# Altium project Lattice_FPGA_development_board.PrjPcb (part 2 of 2)

## Sheet seven_segment_displays.SchDoc
size A3; SheetNumber: 12; SheetTotal: 18; SPICEModelCacheAGOJJZQO: <root> / <DocumentId>AGOJJZQO</DocumentId> / </root>
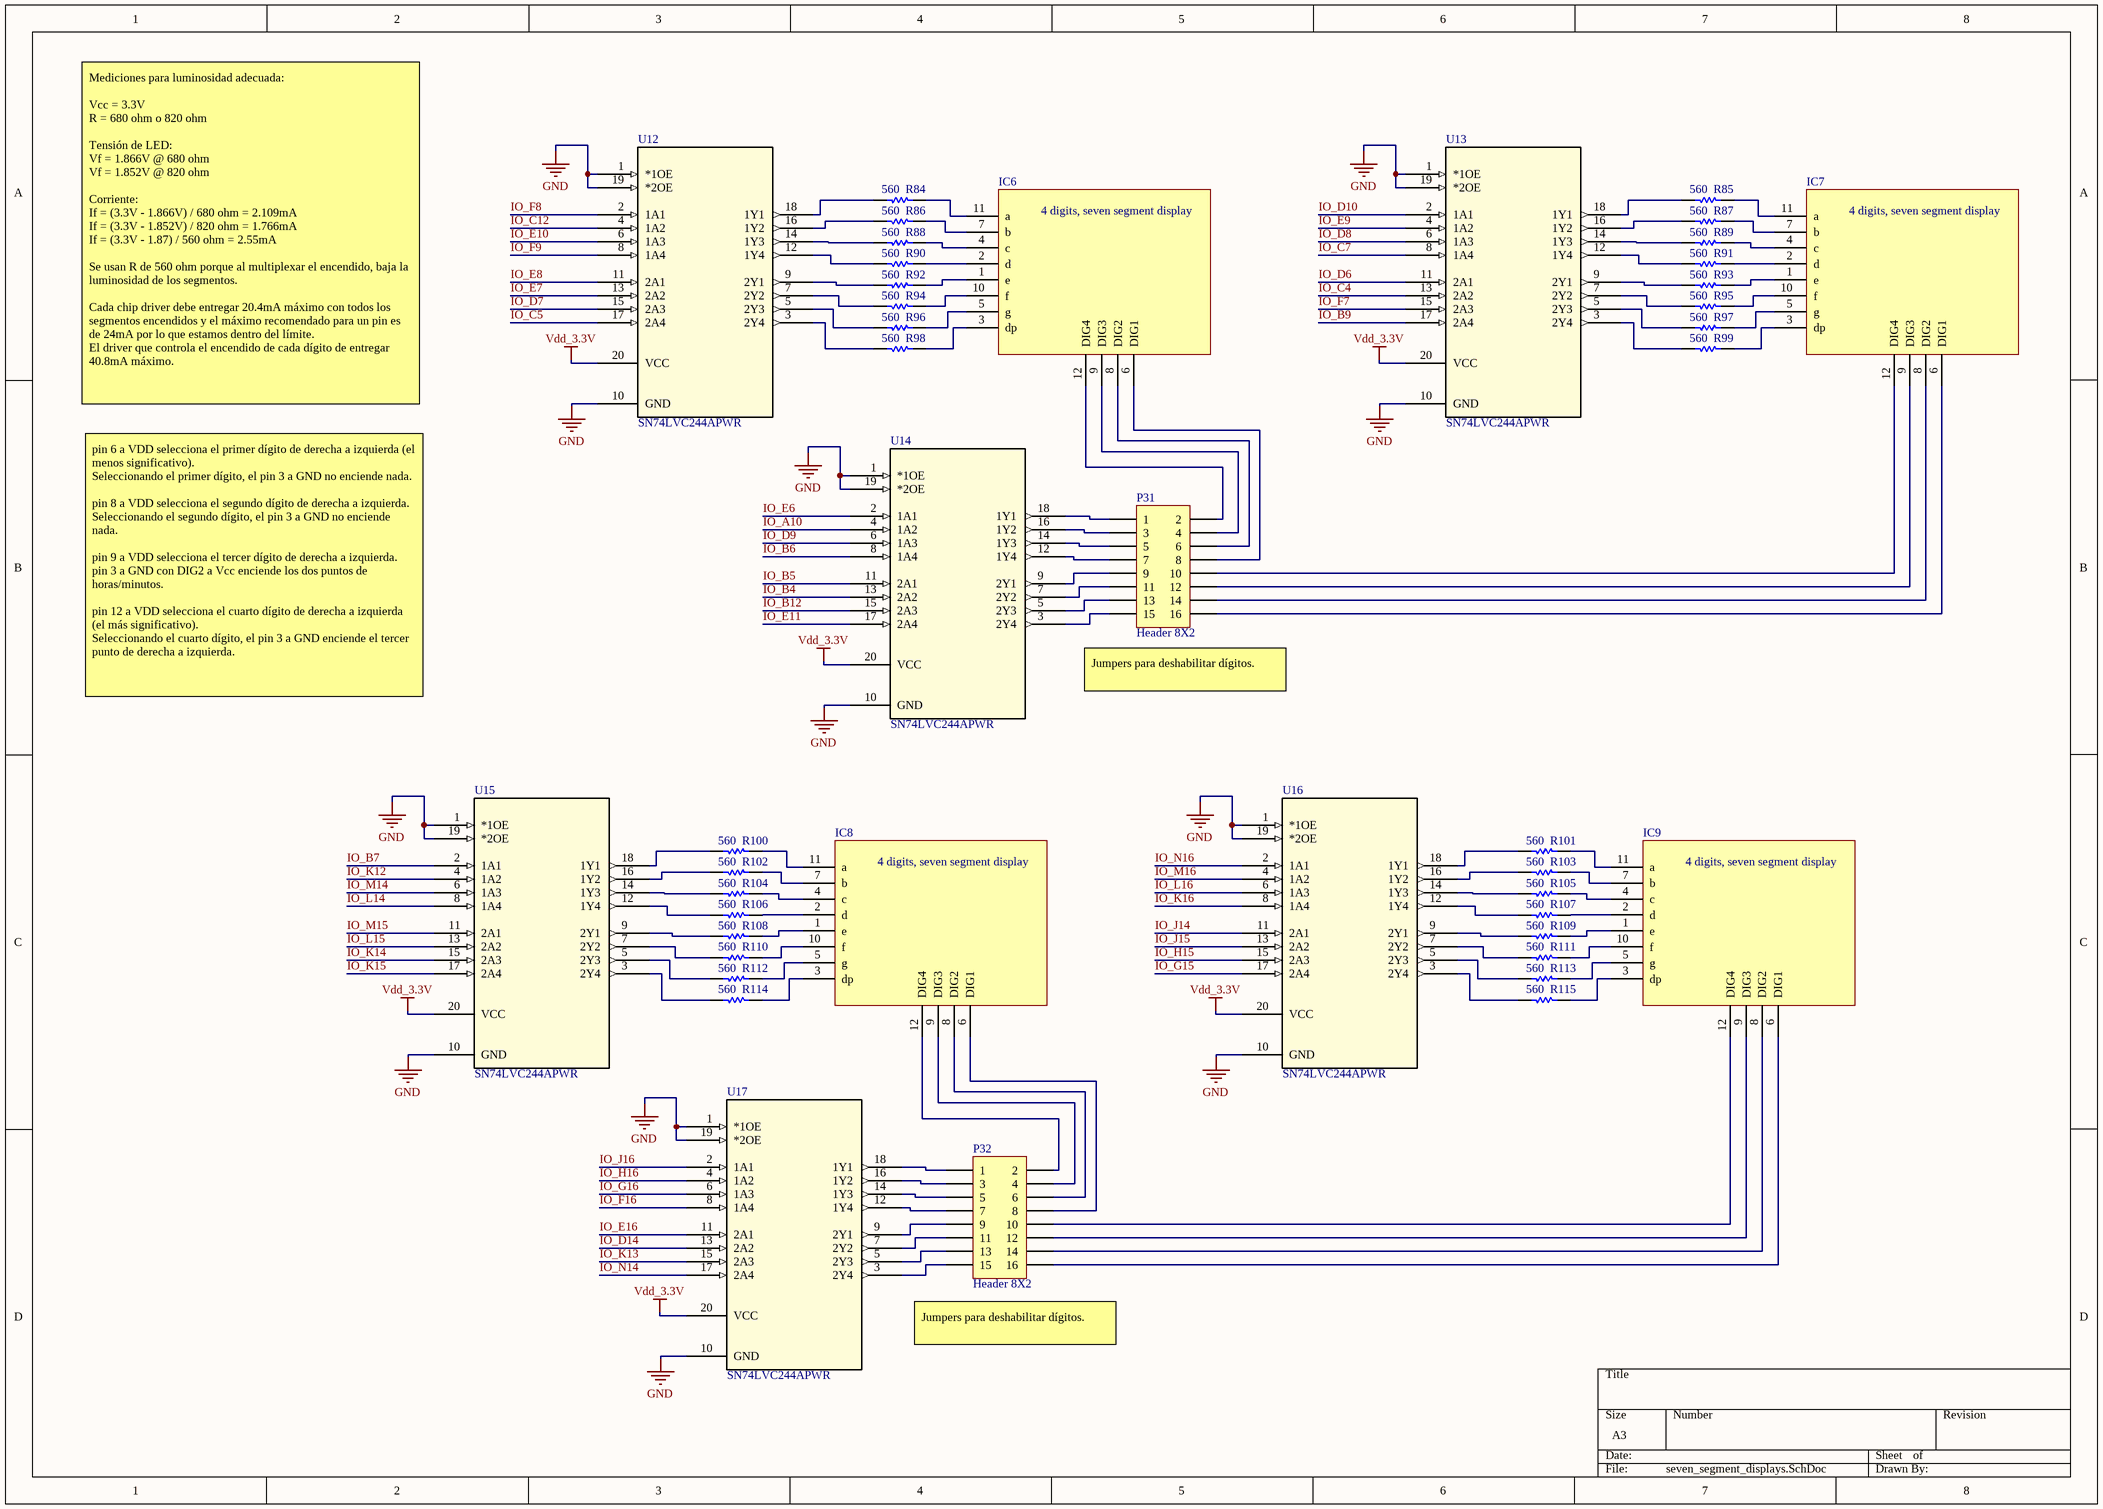
[diagram p10: seven_segment_displays.SchDoc]

### Parts
IC6  Seven segment display x 4 digits  [4 digit, seven segment display / 50.3mm x 19mm]  (value not drawn)
IC7  Seven segment display x 4 digits  [4 digit, seven segment display / 50.3mm x 19mm]  (value not drawn)
IC8  Seven segment display x 4 digits  [4 digit, seven segment display / 50.3mm x 19mm]  (value not drawn)
IC9  Seven segment display x 4 digits  [4 digit, seven segment display / 50.3mm x 19mm]  (value not drawn)
P31  Header 8X2  [HDR2X8]
P32  Header 8X2  [HDR2X8]
R84  value 560  [resistor 0603]  (hidden comment: resistor)
R85  value 560  [resistor 0603]  (hidden comment: resistor)
R86  value 560  [resistor 0603]  (hidden comment: resistor)
R87  value 560  [resistor 0603]  (hidden comment: resistor)
R88  value 560  [resistor 0603]  (hidden comment: resistor)
R89  value 560  [resistor 0603]  (hidden comment: resistor)
R90  value 560  [resistor 0603]  (hidden comment: resistor)
R91  value 560  [resistor 0603]  (hidden comment: resistor)
R92  value 560  [resistor 0603]  (hidden comment: resistor)
R93  value 560  [resistor 0603]  (hidden comment: resistor)
R94  value 560  [resistor 0603]  (hidden comment: resistor)
R95  value 560  [resistor 0603]  (hidden comment: resistor)
R96  value 560  [resistor 0603]  (hidden comment: resistor)
R97  value 560  [resistor 0603]  (hidden comment: resistor)
R98  value 560  [resistor 0603]  (hidden comment: resistor)
R99  value 560  [resistor 0603]  (hidden comment: resistor)
R100  value 560  [resistor 0603]  (hidden comment: resistor)
R101  value 560  [resistor 0603]  (hidden comment: resistor)
R102  value 560  [resistor 0603]  (hidden comment: resistor)
R103  value 560  [resistor 0603]  (hidden comment: resistor)
R104  value 560  [resistor 0603]  (hidden comment: resistor)
R105  value 560  [resistor 0603]  (hidden comment: resistor)
R106  value 560  [resistor 0603]  (hidden comment: resistor)
R107  value 560  [resistor 0603]  (hidden comment: resistor)
R108  value 560  [resistor 0603]  (hidden comment: resistor)
R109  value 560  [resistor 0603]  (hidden comment: resistor)
R110  value 560  [resistor 0603]  (hidden comment: resistor)
R111  value 560  [resistor 0603]  (hidden comment: resistor)
R112  value 560  [resistor 0603]  (hidden comment: resistor)
R113  value 560  [resistor 0603]  (hidden comment: resistor)
R114  value 560  [resistor 0603]  (hidden comment: resistor)
R115  value 560  [resistor 0603]  (hidden comment: resistor)
U12  SN74LVC244APWR  [PW20]
U13  SN74LVC244APWR  [PW20]
U14  SN74LVC244APWR  [PW20]
U15  SN74LVC244APWR  [PW20]
U16  SN74LVC244APWR  [PW20]
U17  SN74LVC244APWR  [PW20]

### Nets
GND: U12.1(*1OE) U12.10(GND) U12.19(*2OE) U13.1(*1OE) U13.10(GND) U13.19(*2OE) U14.1(*1OE) U14.10(GND) U14.19(*2OE) U15.1(*1OE) U15.10(GND) U15.19(*2OE) U16.1(*1OE) U16.10(GND) U16.19(*2OE) U17.1(*1OE) U17.10(GND) U17.19(*2OE)
Vdd_3.3V: U12.20(VCC) U13.20(VCC) U14.20(VCC) U15.20(VCC) U16.20(VCC) U17.20(VCC)
IO_A10: U14.4(1A2)
IO_B4: U14.13(2A2)
IO_B5: U14.11(2A1)
IO_B6: U14.8(1A4)
IO_B7: U15.2(1A1)
IO_B9: U13.17(2A4)
IO_B12: U14.15(2A3)
IO_C4: U13.13(2A2)
IO_C5: U12.17(2A4)
IO_C7: U13.8(1A4)
IO_C12: U12.4(1A2)
IO_D6: U13.11(2A1)
IO_D7: U12.15(2A3)
IO_D8: U13.6(1A3)
IO_D9: U14.6(1A3)
IO_D10: U13.2(1A1)
IO_D14: U17.13(2A2)
IO_E6: U14.2(1A1)
IO_E7: U12.13(2A2)
IO_E8: U12.11(2A1)
IO_E9: U13.4(1A2)
IO_E10: U12.6(1A3)
IO_E11: U14.17(2A4)
IO_E16: U17.11(2A1)
IO_F7: U13.15(2A3)
IO_F8: U12.2(1A1)
IO_F9: U12.8(1A4)
IO_F16: U17.8(1A4)
IO_G15: U16.17(2A4)
IO_G16: U17.6(1A3)
IO_H15: U16.15(2A3)
IO_H16: U17.4(1A2)
IO_J14: U16.11(2A1)
IO_J15: U16.13(2A2)
IO_J16: U17.2(1A1)
IO_K12: U15.4(1A2)
IO_K13: U17.15(2A3)
IO_K14: U15.15(2A3)
IO_K15: U15.17(2A4)
IO_K16: U16.8(1A4)
IO_L14: U15.8(1A4)
IO_L15: U15.13(2A2)
IO_L16: U16.6(1A3)
IO_M14: U15.6(1A3)
IO_M15: U15.11(2A1)
IO_M16: U16.4(1A2)
IO_N14: U17.17(2A4)
IO_N16: U16.2(1A1)
NetIC6_1: IC6.1(e) R92.2
NetIC6_2: IC6.2(d) R90.2
NetIC6_3: IC6.3(dp) R98.2
NetIC6_4: IC6.4(c) R88.2
NetIC6_5: IC6.5(g) R96.2
NetIC6_6: IC6.6(DIG1) P31.8
NetIC6_7: IC6.7(b) R86.2
NetIC6_8: IC6.8(DIG2) P31.6
NetIC6_9: IC6.9(DIG3) P31.4
NetIC6_10: IC6.10(f) R94.2
NetIC6_11: IC6.11(a) R84.2
NetIC6_12: IC6.12(DIG4) P31.2
NetIC7_1: IC7.1(e) R93.2
NetIC7_2: IC7.2(d) R91.2
NetIC7_3: IC7.3(dp) R99.2
NetIC7_4: IC7.4(c) R89.2
NetIC7_5: IC7.5(g) R97.2
NetIC7_6: IC7.6(DIG1) P31.16
NetIC7_7: IC7.7(b) R87.2
NetIC7_8: IC7.8(DIG2) P31.14
NetIC7_9: IC7.9(DIG3) P31.12
NetIC7_10: IC7.10(f) R95.2
NetIC7_11: IC7.11(a) R85.2
NetIC7_12: IC7.12(DIG4) P31.10
NetIC8_1: IC8.1(e) R108.2
NetIC8_2: IC8.2(d) R106.2
NetIC8_3: IC8.3(dp) R114.2
NetIC8_4: IC8.4(c) R104.2
NetIC8_5: IC8.5(g) R112.2
NetIC8_6: IC8.6(DIG1) P32.8
NetIC8_7: IC8.7(b) R102.2
NetIC8_8: IC8.8(DIG2) P32.6
NetIC8_9: IC8.9(DIG3) P32.4
NetIC8_10: IC8.10(f) R110.2
NetIC8_11: IC8.11(a) R100.2
NetIC8_12: IC8.12(DIG4) P32.2
NetIC9_1: IC9.1(e) R109.2
NetIC9_2: IC9.2(d) R107.2
NetIC9_3: IC9.3(dp) R115.2
NetIC9_4: IC9.4(c) R105.2
NetIC9_5: IC9.5(g) R113.2
NetIC9_6: IC9.6(DIG1) P32.16
NetIC9_7: IC9.7(b) R103.2
NetIC9_8: IC9.8(DIG2) P32.14
NetIC9_9: IC9.9(DIG3) P32.12
NetIC9_10: IC9.10(f) R111.2
NetIC9_11: IC9.11(a) R101.2
NetIC9_12: IC9.12(DIG4) P32.10
NetP31_1: P31.1 U14.18(1Y1)
NetP31_3: P31.3 U14.16(1Y2)
NetP31_5: P31.5 U14.14(1Y3)
NetP31_7: P31.7 U14.12(1Y4)
NetP31_9: P31.9 U14.9(2Y1)
NetP31_11: P31.11 U14.7(2Y2)
NetP31_13: P31.13 U14.5(2Y3)
NetP31_15: P31.15 U14.3(2Y4)
NetP32_1: P32.1 U17.18(1Y1)
NetP32_3: P32.3 U17.16(1Y2)
NetP32_5: P32.5 U17.14(1Y3)
NetP32_7: P32.7 U17.12(1Y4)
NetP32_9: P32.9 U17.9(2Y1)
NetP32_11: P32.11 U17.7(2Y2)
NetP32_13: P32.13 U17.5(2Y3)
NetP32_15: P32.15 U17.3(2Y4)
NetR84_1: R84.1 U12.18(1Y1)
NetR85_1: R85.1 U13.18(1Y1)
NetR86_1: R86.1 U12.16(1Y2)
NetR87_1: R87.1 U13.16(1Y2)
NetR88_1: R88.1 U12.14(1Y3)
NetR89_1: R89.1 U13.14(1Y3)
NetR90_1: R90.1 U12.12(1Y4)
NetR91_1: R91.1 U13.12(1Y4)
NetR92_1: R92.1 U12.9(2Y1)
NetR93_1: R93.1 U13.9(2Y1)
NetR94_1: R94.1 U12.7(2Y2)
NetR95_1: R95.1 U13.7(2Y2)
NetR96_1: R96.1 U12.5(2Y3)
NetR97_1: R97.1 U13.5(2Y3)
NetR98_1: R98.1 U12.3(2Y4)
NetR99_1: R99.1 U13.3(2Y4)
NetR100_1: R100.1 U15.18(1Y1)
NetR101_1: R101.1 U16.18(1Y1)
NetR102_1: R102.1 U15.16(1Y2)
NetR103_1: R103.1 U16.16(1Y2)
NetR104_1: R104.1 U15.14(1Y3)
NetR105_1: R105.1 U16.14(1Y3)
NetR106_1: R106.1 U15.12(1Y4)
NetR107_1: R107.1 U16.12(1Y4)
NetR108_1: R108.1 U15.9(2Y1)
NetR109_1: R109.1 U16.9(2Y1)
NetR110_1: R110.1 U15.7(2Y2)
NetR111_1: R111.1 U16.7(2Y2)
NetR112_1: R112.1 U15.5(2Y3)
NetR113_1: R113.1 U16.5(2Y3)
NetR114_1: R114.1 U15.3(2Y4)
NetR115_1: R115.1 U16.3(2Y4)

### Notes on the sheet
- Mediciones para luminosidad adecuada:
  Vcc = 3.3V
  R = 680 ohm o 820 ohm
  Tensión de LED:
  Vf = 1.866V @ 680 ohm
  Vf = 1.852V @ 820 ohm
  Corriente:
  If = (3.3V - 1.866V) / 680 ohm = 2.109mA
  If = (3.3V - 1.852V) / 820 ohm = 1.766mA
  If = (3.3V - 1.87) / 560 ohm = 2.55mA
  Se usan R de 560 ohm porque al multiplexar el encendido, baja la luminosidad de los segmentos.
  Cada chip driver debe entregar 20.4mA máximo con todos los segmentos encendidos y el máximo recomendado para un pin es de 24mA por lo que estamos dentro del límite.
  El driver que controla el encendido de cada dígito de entregar 40.8mA máximo.
- pin 6 a VDD selecciona el primer dígito de derecha a izquierda (el menos significativo).
  Seleccionando el primer dígito, el pin 3 a GND no enciende nada.
  pin 8 a VDD selecciona el segundo dígito de derecha a izquierda.
  Seleccionando el segundo dígito, el pin 3 a GND no enciende nada.
  pin 9 a VDD selecciona el tercer dígito de derecha a izquierda.
  pin 3 a GND con DIG2 a Vcc enciende los dos puntos de horas/minutos.
  pin 12 a VDD selecciona el cuarto dígito de derecha a izquierda (el más significativo).
  Seleccionando el cuarto dígito, el pin 3 a GND enciende el tercer punto de derecha a izquierda.
- (near P31) Jumpers para deshabilitar dígitos.
- Jumpers para deshabilitar dígitos.
- (in symbol Seven segment display x 4 digits) 4 digits, seven segment display

### Library data of the parts
IC6-IC9 = Seven segment display x 4 digits: Seven segment display x 4 digits with 4 decimal points and hours/minutes divider.
P31 P32 = Header 8X2: Header, 8-Pin, Dual row; LatestRevisionDate: 17-Jul-2002; LatestRevisionNote: Re-released for DXP Platform.; Publisher: Altium Limited
U12-U17 = SN74LVC244APWR: 8-ch, 1.65-V to 3.6-V buffers with 3-state outputs 20-TSSOP -40 to 125; Manufacturer_Name: Texas Instruments; Copyright: Copyright (C) 2026 Ultra Librarian. All rights reserved.; Manufacturer_Part_Number: SN74LVC244APWR; Datasheet: https://www.ti.com/lit/gpn/sn74lvc244a; RefDes: RefDes; Type: Type
R84-R115 = resistor: Package: 0603

## Sheet buzzer.SchDoc
size A3; SheetNumber: 13; SheetTotal: 18; SPICEModelCacheMSYVYFRR: <root> / <DocumentId>MSYVYFRR</DocumentId> / <CacheFrame Number="0"> / <Model Name="nmos" Kind="MDL"> / <Text>*Default N-Channel MOSFET / *Pinout: D,G,S / .MODEL NMOS NMOS()</Text> / </Model> / </CacheFrame> / </root>
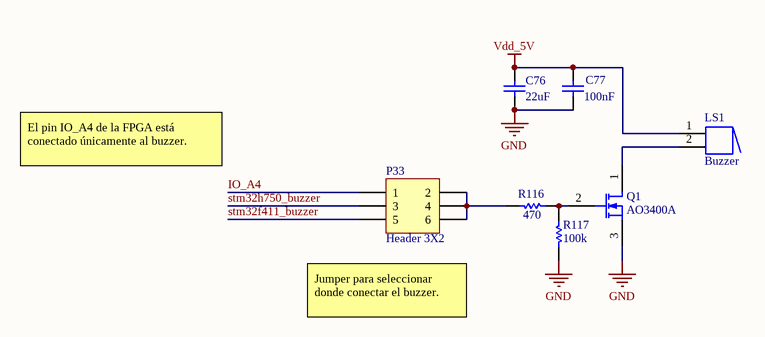
[diagram p11: buzzer.SchDoc]

### Parts
C76  value 22uF  [capacitor 0603]  (hidden comment: ceramic capacitor)
C77  value 100nF  [capacitor 0805]  (hidden comment: ceramic capacitor)
LS1  Buzzer  [Buzzer 12mm x 8.25mm - 6.5mm pitch]
P33  Header 3X2  [HDR2X3]
Q1  AO3400A  [sot-23]
R116  value 470  [resistor 0603]  (hidden comment: resistor)
R117  value 100k  [resistor 0603]  (hidden comment: resistor)

### Nets
GND: C76.1 C77.2 Q1.3(S) R117.2
Vdd_5V: C76.2 C77.1 LS1.1
IO_A4: P33.1
stm32f411_buzzer: P33.5
stm32h750_buzzer: P33.3
NetLS1_2: LS1.2 Q1.1(D)
NetP33_2: P33.2 P33.4 P33.6 R116.1
NetQ1_2: Q1.2(G) R116.2 R117.1

### Notes on the sheet
- El pin IO_A4 de la FPGA está conectado únicamente al buzzer.
- (near P33) Jumper para seleccionar donde conectar el buzzer.

### Library data of the parts
C76 = ceramic capacitor: Multilayer ceramic capacitor; V: 6.3; LCSC part: C59461; Package: 0603
C77 = ceramic capacitor: Multilayer ceramic capacitor; V: 50; LCSC part: C1711; Package: 0805
LS1 = Buzzer: Magnetic Transducer Buzzer; pin to pad: 1A>none 2A>none; Published: 24-Mar-1999; LatestRevisionDate: 17-Dec-2003; LatestRevisionNote: Schematic revised, PCB Footprint replaced.; DatasheetVersion: 17-Dec-2003; PackageReference: ABSM-1574; Publisher: Altium Limited; PackageDescription: Magnetic Transducer Buzzer; ComponentLink1Description: Manufacturer Link; ComponentLink1URL: http://www.megastar.com/linecard/buzzmode/index.php
P33 = Header 3X2: Header, 3-Pin, Dual row; LatestRevisionDate: 17-Jul-2002; LatestRevisionNote: Re-released for DXP Platform.; Publisher: Altium Limited
Q1 = MOSFET-N: N-Channel MOSFET; pin to pad: 1>3 2>1 3>2; MFR: Alpha & Omega Semicon; Package: SOT-23-3L; LCSC part: C20917; MFR part: AO3400A
R116 R117 = resistor: Package: 0603

## Sheet USB_TTL_converter.SchDoc
size A3; SheetNumber: 14; SheetTotal: 18
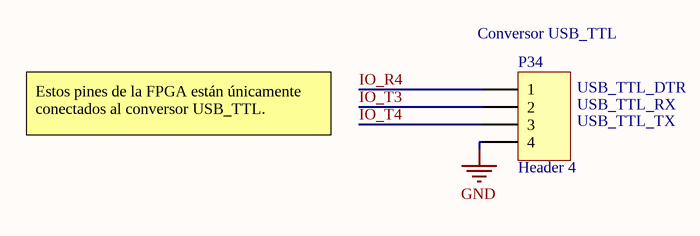
[diagram p12: USB_TTL_converter.SchDoc]

### Parts
P34  Header 4  [HDR1X4]

### Nets
GND: P34.4
IO_R4: P34.1
IO_T3: P34.2
IO_T4: P34.3

### Notes on the sheet
- (near P34) Conversor USB_TTL
- (near P34) USB_TTL_DTR
- (near P34) USB_TTL_RX
- Estos pines de la FPGA están únicamente conectados al conversor USB_TTL.
- (near P34) USB_TTL_TX

### Library data of the parts
P34 = Header 4: Header, 4-Pin; LatestRevisionDate: 17-Jul-2002; LatestRevisionNote: Re-released for DXP Platform.; Publisher: Altium Limited

## Sheet micro_sd.SchDoc
size A3; SheetNumber: 14; SheetTotal: 18
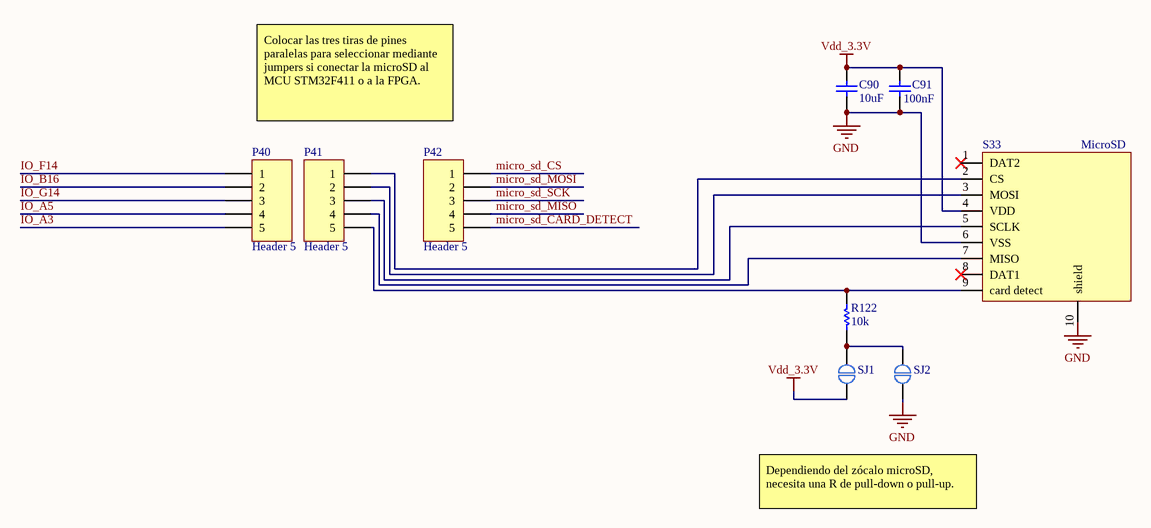
[diagram p13: micro_sd.SchDoc]

### Parts
C90  value 10uF  [capacitor 0603]  (hidden comment: ceramic capacitor)
C91  value 100nF  [capacitor 0603]  (hidden comment: Ceramic capacitor)
P40  Header 5  [HDR1X5]
P41  Header 5  [HDR1X5]
P42  Header 5  [HDR1X5]
R122  value 10k  [resistor 0603]  (hidden comment: resistor)
S33  MicroSD  [Micro sd]
SJ1  Solder jumper NO  [normally open solder jumper]  (value not drawn)
SJ2  Solder jumper NO  [normally open solder jumper]  (value not drawn)

### Nets
GND: C90.1 C91.1 S33.6(VSS) S33.10(shield) SJ2.1
Vdd_3.3V: C90.2 C91.2 S33.4(VDD) SJ1.1
IO_A3: P40.5
IO_A5: P40.4
IO_B16: P40.2
IO_F14: P40.1
IO_G14: P40.3
micro_sd_CARD_DETECT: P42.5
micro_sd_CS: P42.1
micro_sd_MISO: P42.4
micro_sd_MOSI: P42.2
micro_sd_SCK: P42.3
NetP41_1: P41.1 S33.2(CS)
NetP41_2: P41.2 S33.3(MOSI)
NetP41_3: P41.3 S33.5(SCLK)
NetP41_4: P41.4 S33.7(MISO)
NetP41_5: P41.5 R122.1 S33.9(card_detect)
NetR122_2: R122.2 SJ1.2 SJ2.2

Not connected (* = marked no-connect by the designer): S33 1(DAT2)* 8(DAT1)*

### Notes on the sheet
- Colocar las tres tiras de pines paralelas para seleccionar mediante jumpers si conectar la microSD al MCU STM32F411 o a la FPGA.
- Dependiendo del zócalo microSD, necesita una R de pull-down o pull-up.

### Library data of the parts
C90 = ceramic capacitor: Multilayer ceramic capacitor; V: 6.3; LCSC part: C1691; Package: 0603
C91 = Ceramic capacitor: Multilayer ceramic capacitor; V: 50; LCSC part: C14663; Package: 0603
P40-P42 = Header 5: Header, 5-Pin; LatestRevisionDate: 17-Jul-2002; LatestRevisionNote: Re-released for DXP Platform.; Publisher: Altium Limited
S33 = Micro SD: Micro SD memory
SJ1 SJ2 = Solder jumper NO: Normally open solder jumper
R122 = resistor: Package: 0603

## Sheet NOR_flash.SchDoc
size A3; SheetNumber: 15; SheetTotal: 18
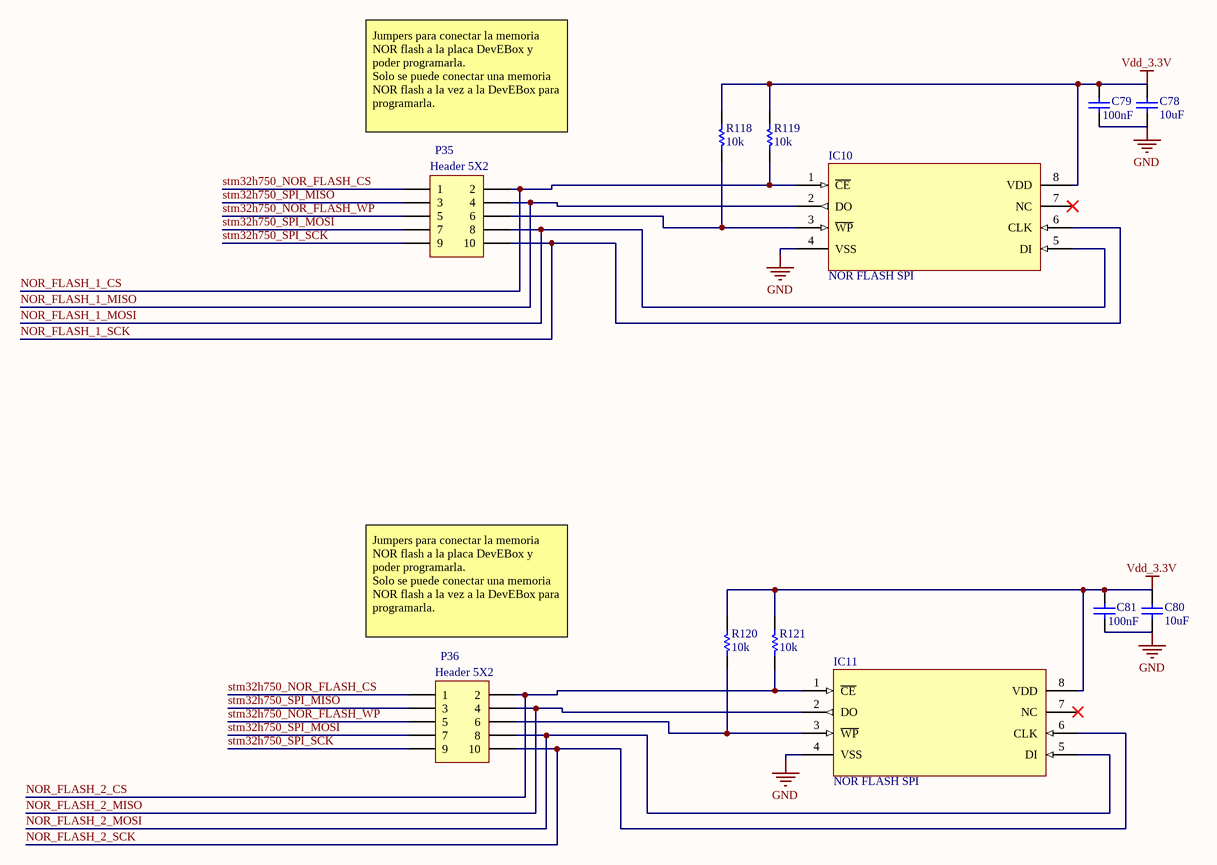
[diagram p14: NOR_flash.SchDoc]

### Parts
C78  value 10uF  [capacitor 0603]  (hidden comment: ceramic capacitor)
C79  value 100nF  [capacitor 0603]  (hidden comment: Ceramic capacitor)
C80  value 10uF  [capacitor 0603]  (hidden comment: ceramic capacitor)
C81  value 100nF  [capacitor 0603]  (hidden comment: Ceramic capacitor)
IC10  NOR FLASH SPI  [SOP8 / SOIC8 without dissipation]
IC11  NOR FLASH SPI  [SOP8 / SOIC8 without dissipation]
P35  Header 5X2  [HDR2X5]
P36  Header 5X2  [HDR2X5]
R118  value 10k  [resistor 0603]  (hidden comment: resistor)
R119  value 10k  [resistor 0603]  (hidden comment: resistor)
R120  value 10k  [resistor 0603]  (hidden comment: resistor)
R121  value 10k  [resistor 0603]  (hidden comment: resistor)

### Nets
GND: C78.1 C79.1 C80.1 C81.1 IC10.4(VSS) IC11.4(VSS)
Vdd_3.3V: C78.2 C79.2 C80.2 C81.2 IC10.8(VDD) IC11.8(VDD) R118.1 R119.1 R120.1 R121.1
NOR_FLASH_1_CS: IC10.1(~{CE}) P35.2 R119.2
NOR_FLASH_1_MISO: IC10.2(DO) P35.4
NOR_FLASH_1_MOSI: IC10.5(DI) P35.8
NOR_FLASH_1_SCK: IC10.6(CLK) P35.10
NOR_FLASH_2_CS: IC11.1(~{CE}) P36.2 R121.2
NOR_FLASH_2_MISO: IC11.2(DO) P36.4
NOR_FLASH_2_MOSI: IC11.5(DI) P36.8
NOR_FLASH_2_SCK: IC11.6(CLK) P36.10
stm32h750_NOR_FLASH_CS: P35.1 P36.1
stm32h750_NOR_FLASH_WP: P35.5 P36.5
stm32h750_SPI_MISO: P35.3 P36.3
stm32h750_SPI_MOSI: P35.7 P36.7
stm32h750_SPI_SCK: P35.9 P36.9
NetIC10_3: IC10.3(~{WP}) P35.6 R118.2
NetIC11_3: IC11.3(~{WP}) P36.6 R120.2

Not connected (* = marked no-connect by the designer): IC10 7(NC)*; IC11 7(NC)*

### Notes on the sheet
- Jumpers para conectar la memoria NOR flash a la placa DevEBox y poder programarla.
  Solo se puede conectar una memoria NOR flash a la vez a la DevEBox para programarla.

### Library data of the parts
C78 C80 = ceramic capacitor: Multilayer ceramic capacitor; V: 6.3; LCSC part: C1691; Package: 0603
C79 C81 = Ceramic capacitor: Multilayer ceramic capacitor; V: 50; LCSC part: C14663; Package: 0603
IC10 IC11 = NOR FLASH SPI: NOR flash memory / SPI
P35 P36 = Header 5X2: Header, 5-Pin, Dual row; LatestRevisionDate: 17-Jul-2002; LatestRevisionNote: Re-released for DXP Platform.; Publisher: Altium Limited
R118-R121 = resistor: Package: 0603

## Sheet stm32h750.SchDoc
size A3; SheetNumber: 16; SheetTotal: 18
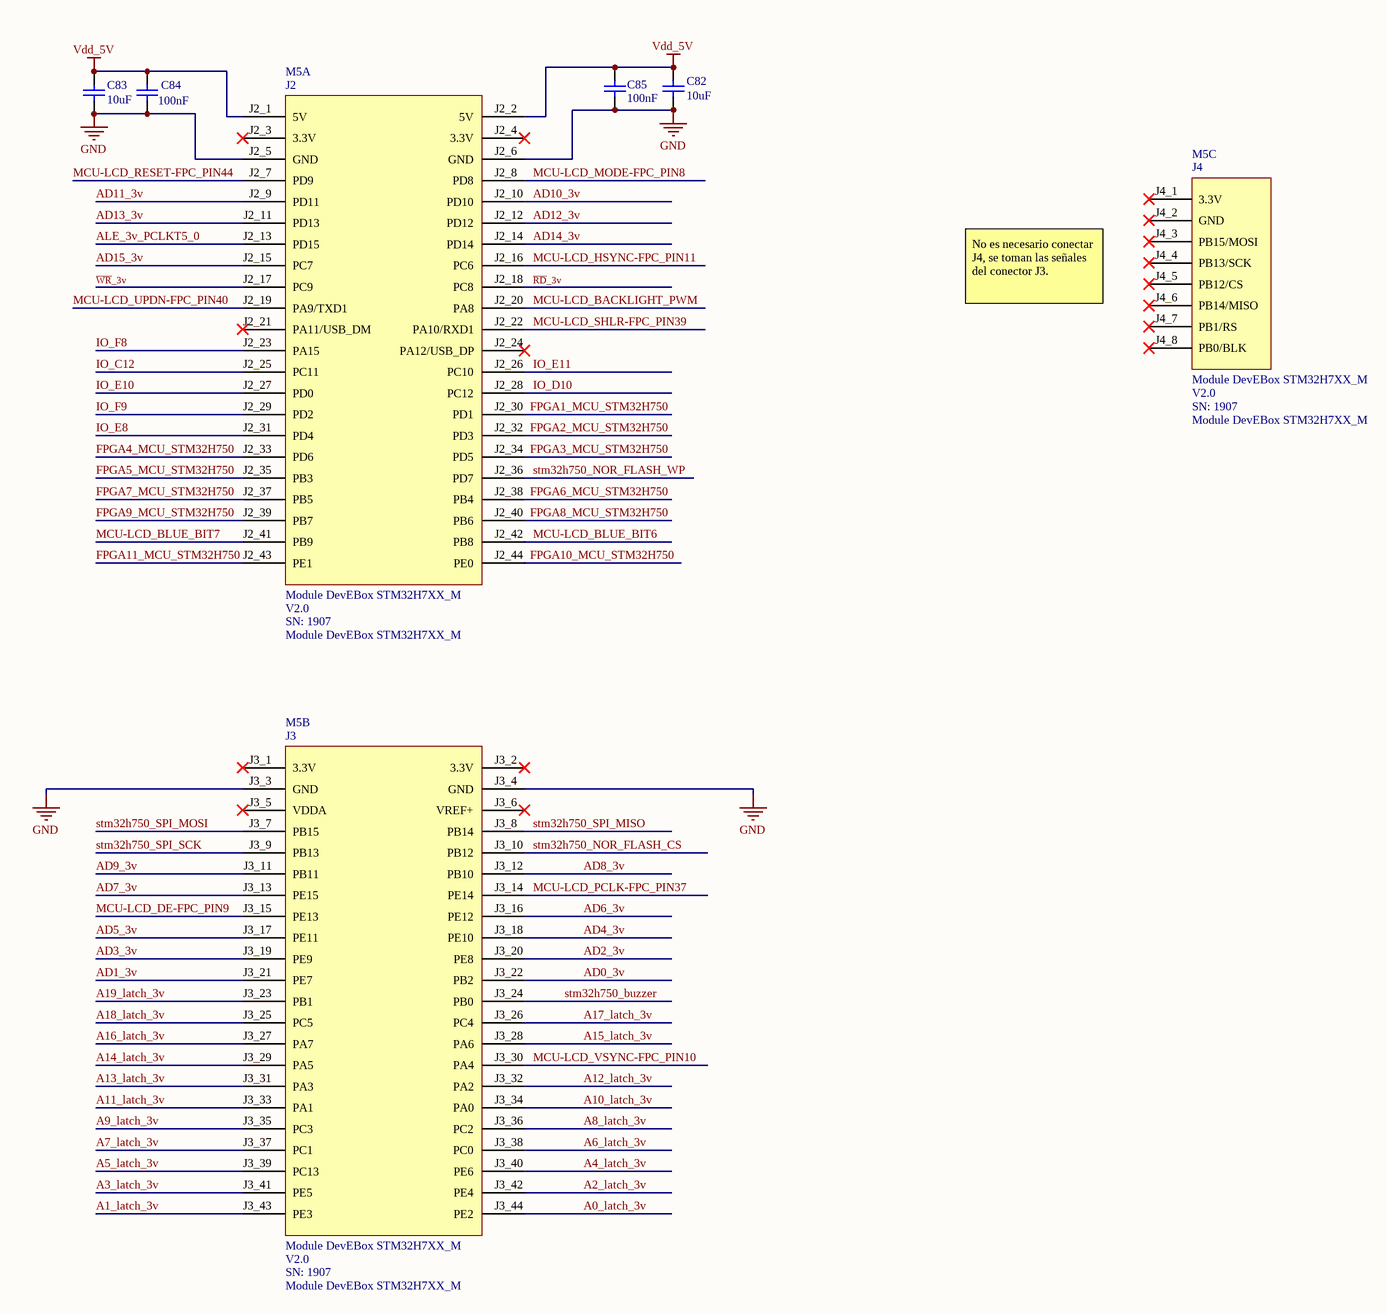
[diagram p15: stm32h750.SchDoc]

### Parts
C82  value 10uF  [capacitor 0603]  (hidden comment: ceramic capacitor)
C83  value 10uF  [capacitor 0603]  (hidden comment: ceramic capacitor)
C84  value 100nF  [capacitor 0603]  (hidden comment: Ceramic capacitor)
C85  value 100nF  [capacitor 0603]  (hidden comment: Ceramic capacitor)
M5  Module DevEBox STM32H7XX_M  [Module DevEBox STM32H7XX_M]  (parts A,B,C of 3)

### Nets
GND: C82.1 C83.1 C84.1 C85.1 M5.J2_5(GND) M5.J2_6(GND) M5.J3_3(GND) M5.J3_4(GND)
Vdd_5V: C82.2 C83.2 C84.2 C85.2 M5.J2_1(5V) M5.J2_2(5V)
A0_latch_3v: M5.J3_44(PE2)
A1_latch_3v: M5.J3_43(PE3)
A2_latch_3v: M5.J3_42(PE4)
A3_latch_3v: M5.J3_41(PE5)
A4_latch_3v: M5.J3_40(PE6)
A5_latch_3v: M5.J3_39(PC13)
A6_latch_3v: M5.J3_38(PC0)
A7_latch_3v: M5.J3_37(PC1)
A8_latch_3v: M5.J3_36(PC2)
A9_latch_3v: M5.J3_35(PC3)
A10_latch_3v: M5.J3_34(PA0)
A11_latch_3v: M5.J3_33(PA1)
A12_latch_3v: M5.J3_32(PA2)
A13_latch_3v: M5.J3_31(PA3)
A14_latch_3v: M5.J3_29(PA5)
A15_latch_3v: M5.J3_28(PA6)
A16_latch_3v: M5.J3_27(PA7)
A17_latch_3v: M5.J3_26(PC4)
A18_latch_3v: M5.J3_25(PC5)
A19_latch_3v: M5.J3_23(PB1)
AD0_3v: M5.J3_22(PB2)
AD1_3v: M5.J3_21(PE7)
AD2_3v: M5.J3_20(PE8)
AD3_3v: M5.J3_19(PE9)
AD4_3v: M5.J3_18(PE10)
AD5_3v: M5.J3_17(PE11)
AD6_3v: M5.J3_16(PE12)
AD7_3v: M5.J3_13(PE15)
AD8_3v: M5.J3_12(PB10)
AD9_3v: M5.J3_11(PB11)
AD10_3v: M5.J2_10(PD10)
AD11_3v: M5.J2_9(PD11)
AD12_3v: M5.J2_12(PD12)
AD13_3v: M5.J2_11(PD13)
AD14_3v: M5.J2_14(PD14)
AD15_3v: M5.J2_15(PC7)
ALE_3v_PCLKT5_0: M5.J2_13(PD15)
FPGA1_MCU_STM32H750: M5.J2_30(PD1)
FPGA2_MCU_STM32H750: M5.J2_32(PD3)
FPGA3_MCU_STM32H750: M5.J2_34(PD5)
FPGA4_MCU_STM32H750: M5.J2_33(PD6)
FPGA5_MCU_STM32H750: M5.J2_35(PB3)
FPGA6_MCU_STM32H750: M5.J2_38(PB4)
FPGA7_MCU_STM32H750: M5.J2_37(PB5)
FPGA8_MCU_STM32H750: M5.J2_40(PB6)
FPGA9_MCU_STM32H750: M5.J2_39(PB7)
FPGA10_MCU_STM32H750: M5.J2_44(PE0)
FPGA11_MCU_STM32H750: M5.J2_43(PE1)
IO_C12: M5.J2_25(PC11)
IO_D10: M5.J2_28(PC12)
IO_E8: M5.J2_31(PD4)
IO_E10: M5.J2_27(PD0)
IO_E11: M5.J2_26(PC10)
IO_F8: M5.J2_23(PA15)
IO_F9: M5.J2_29(PD2)
MCU-LCD_BACKLIGHT_PWM: M5.J2_20(PA8)
MCU-LCD_BLUE_BIT6: M5.J2_42(PB8)
MCU-LCD_BLUE_BIT7: M5.J2_41(PB9)
MCU-LCD_DE-FPC_PIN9: M5.J3_15(PE13)
MCU-LCD_HSYNC-FPC_PIN11: M5.J2_16(PC6)
MCU-LCD_MODE-FPC_PIN8: M5.J2_8(PD8)
MCU-LCD_PCLK-FPC_PIN37: M5.J3_14(PE14)
MCU-LCD_RESET-FPC_PIN44: M5.J2_7(PD9)
MCU-LCD_SHLR-FPC_PIN39: M5.J2_22(PA10/RXD1)
MCU-LCD_UPDN-FPC_PIN40: M5.J2_19(PA9/TXD1)
MCU-LCD_VSYNC-FPC_PIN10: M5.J3_30(PA4)
~{RD}_3v: M5.J2_18(PC8)
stm32h750_buzzer: M5.J3_24(PB0)
stm32h750_NOR_FLASH_CS: M5.J3_10(PB12)
stm32h750_NOR_FLASH_WP: M5.J2_36(PD7)
stm32h750_SPI_MISO: M5.J3_8(PB14)
stm32h750_SPI_MOSI: M5.J3_7(PB15)
stm32h750_SPI_SCK: M5.J3_9(PB13)
~{WR}_3v: M5.J2_17(PC9)

Not connected (* = marked no-connect by the designer): M5 J2_3(3.3V)* J2_4(3.3V)* J2_21(PA11/USB_DM)* J2_24(PA12/USB_DP)* J3_1(3.3V)* J3_2(3.3V)* J3_5(VDDA)* J3_6(VREF+)* J4_1(3.3V)* J4_2(GND)* J4_3(PB15/MOSI)* J4_4(PB13/SCK)* J4_5(PB12/CS)* J4_6(PB14/MISO)* J4_7(PB1/RS)* J4_8(PB0/BLK)*

### Notes on the sheet
- No es necesario conectar J4, se toman las señales del conector J3.
- (in symbol Module DevEBox STM32H7XX_M, part A) J2; V2.0; SN: 1907
- (in symbol Module DevEBox STM32H7XX_M, part B) J3; V2.0; SN: 1907
- (in symbol Module DevEBox STM32H7XX_M, part C) J4; V2.0; SN: 1907

### Library data of the parts
C82 C83 = ceramic capacitor: Multilayer ceramic capacitor; V: 6.3; LCSC part: C1691; Package: 0603
C84 C85 = Ceramic capacitor: Multilayer ceramic capacitor; V: 50; LCSC part: C14663; Package: 0603
M5 = Module DevEBox STM32H7XX_M: Module DevEBox STM32H7XX_M / V2.0 / SN: 1907

## Sheet LCD_RGB_parallel_connector.SchDoc
size A3; SheetNumber: 17; SheetTotal: 18
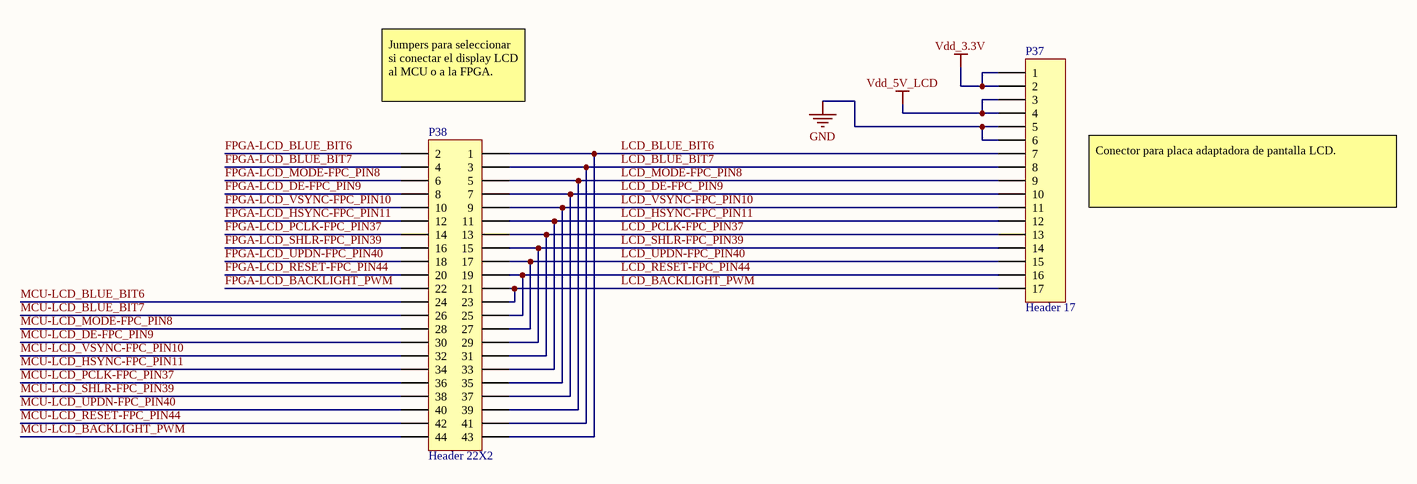
[diagram p16: LCD_RGB_parallel_connector.SchDoc]

### Parts
P37  Header 17  [HDR1X17]
P38  Header 22X2  [HDR2X22]

### Nets
GND: P37.5 P37.6
Vdd_3.3V: P37.1 P37.2
Vdd_5V_LCD: P37.3 P37.4
FPGA-LCD_BACKLIGHT_PWM: P38.22
FPGA-LCD_BLUE_BIT6: P38.2
FPGA-LCD_BLUE_BIT7: P38.4
FPGA-LCD_DE-FPC_PIN9: P38.8
FPGA-LCD_HSYNC-FPC_PIN11: P38.12
FPGA-LCD_MODE-FPC_PIN8: P38.6
FPGA-LCD_PCLK-FPC_PIN37: P38.14
FPGA-LCD_RESET-FPC_PIN44: P38.20
FPGA-LCD_SHLR-FPC_PIN39: P38.16
FPGA-LCD_UPDN-FPC_PIN40: P38.18
FPGA-LCD_VSYNC-FPC_PIN10: P38.10
LCD_BACKLIGHT_PWM: P37.17 P38.21 P38.23
LCD_BLUE_BIT6: P37.7 P38.1 P38.43
LCD_BLUE_BIT7: P37.8 P38.3 P38.41
LCD_DE-FPC_PIN9: P37.10 P38.7 P38.37
LCD_HSYNC-FPC_PIN11: P37.12 P38.11 P38.33
LCD_MODE-FPC_PIN8: P37.9 P38.5 P38.39
LCD_PCLK-FPC_PIN37: P37.13 P38.13 P38.31
LCD_RESET-FPC_PIN44: P37.16 P38.19 P38.25
LCD_SHLR-FPC_PIN39: P37.14 P38.15 P38.29
LCD_UPDN-FPC_PIN40: P37.15 P38.17 P38.27
LCD_VSYNC-FPC_PIN10: P37.11 P38.9 P38.35
MCU-LCD_BACKLIGHT_PWM: P38.44
MCU-LCD_BLUE_BIT6: P38.24
MCU-LCD_BLUE_BIT7: P38.26
MCU-LCD_DE-FPC_PIN9: P38.30
MCU-LCD_HSYNC-FPC_PIN11: P38.34
MCU-LCD_MODE-FPC_PIN8: P38.28
MCU-LCD_PCLK-FPC_PIN37: P38.36
MCU-LCD_RESET-FPC_PIN44: P38.42
MCU-LCD_SHLR-FPC_PIN39: P38.38
MCU-LCD_UPDN-FPC_PIN40: P38.40
MCU-LCD_VSYNC-FPC_PIN10: P38.32

### Notes on the sheet
- (near P38) Jumpers para seleccionar si conectar el display LCD al MCU o a la FPGA.
- Conector para placa adaptadora de pantalla LCD.

### Library data of the parts
P37 = Header 17: Header, 17-Pin; LatestRevisionDate: 17-Jul-2002; LatestRevisionNote: Re-released for DXP Platform.; Publisher: Altium Limited
P38 = Header 22X2: Header, 22-Pin, Dual row; LatestRevisionDate: 17-Jul-2002; LatestRevisionNote: Re-released for DXP Platform.; Publisher: Altium Limited

## Sheet stm32f411.SchDoc
size A3; SheetNumber: 18; SheetTotal: 19
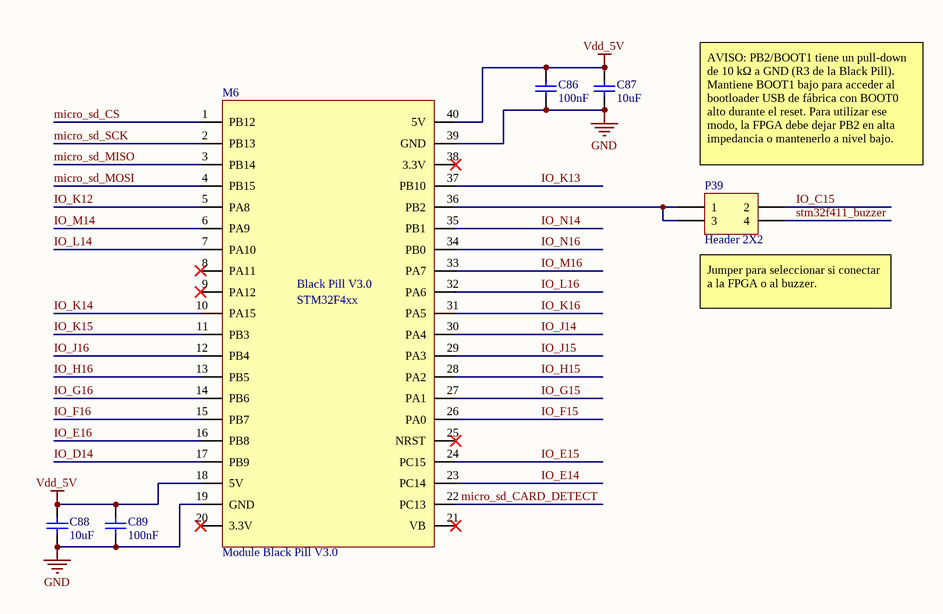
[diagram p17: stm32f411.SchDoc]

### Parts
C86  value 100nF  [capacitor 0603]  (hidden comment: Ceramic capacitor)
C87  value 10uF  [capacitor 0603]  (hidden comment: ceramic capacitor)
C88  value 10uF  [capacitor 0603]  (hidden comment: ceramic capacitor)
C89  value 100nF  [capacitor 0603]  (hidden comment: Ceramic capacitor)
M6  Module Black Pill V3.0  [module black pill v3.0]
P39  Header 2X2  [HDR2X2]

### Nets
GND: C86.1 C87.1 C88.1 C89.1 M6.19(GND) M6.39(GND)
Vdd_5V: C86.2 C87.2 C88.2 C89.2 M6.18(5V) M6.40(5V)
IO_C15: P39.2
IO_D14: M6.17(PB9)
IO_E14: M6.23(PC14)
IO_E15: M6.24(PC15)
IO_E16: M6.16(PB8)
IO_F15: M6.26(PA0)
IO_F16: M6.15(PB7)
IO_G15: M6.27(PA1)
IO_G16: M6.14(PB6)
IO_H15: M6.28(PA2)
IO_H16: M6.13(PB5)
IO_J14: M6.30(PA4)
IO_J15: M6.29(PA3)
IO_J16: M6.12(PB4)
IO_K12: M6.5(PA8)
IO_K13: M6.37(PB10)
IO_K14: M6.10(PA15)
IO_K15: M6.11(PB3)
IO_K16: M6.31(PA5)
IO_L14: M6.7(PA10)
IO_L16: M6.32(PA6)
IO_M14: M6.6(PA9)
IO_M16: M6.33(PA7)
IO_N14: M6.35(PB1)
IO_N16: M6.34(PB0)
micro_sd_CARD_DETECT: M6.22(PC13)
micro_sd_CS: M6.1(PB12)
micro_sd_MISO: M6.3(PB14)
micro_sd_MOSI: M6.4(PB15)
micro_sd_SCK: M6.2(PB13)
stm32f411_buzzer: P39.4
NetM6_36: M6.36(PB2) P39.1 P39.3

Not connected (* = marked no-connect by the designer): M6 8(PA11)* 9(PA12)* 20(3.3V)* 21(VB)* 25(NRST)* 38(3.3V)*

### Notes on the sheet
- (near P39) AVISO: PB2/BOOT1 tiene un pull-down de 10 kΩ a GND (R3 de la Black Pill). Mantiene BOOT1 bajo para acceder al bootloader USB de fábrica con BOOT0 alto durante el reset. Para utilizar ese modo, la FPGA debe dejar PB2 en alta impedancia o mantenerlo a nivel bajo.
- (near P39) Jumper para seleccionar si conectar a la FPGA o al buzzer.
- (in symbol Module Black Pill V3.0) Black Pill V3.0; STM32F4xx

### Library data of the parts
C86 C89 = Ceramic capacitor: Multilayer ceramic capacitor; V: 50; LCSC part: C14663; Package: 0603
C87 C88 = ceramic capacitor: Multilayer ceramic capacitor; V: 6.3; LCSC part: C1691; Package: 0603
M6 = Module Black Pill V3.0: Module Black Pill V3.0 / STM32F4xx
P39 = Header 2X2: Header, 2-Pin, Dual row; LatestRevisionDate: 17-Jul-2002; LatestRevisionNote: Re-released for DXP Platform.; Publisher: Altium Limited

## Nets that join several sheets
GND: power_supply (20 pins), FPGA_J3_J4 (13 pins), FPGA_J6_J8 (28 pins), FPGA_breadboard_connections (8 pins), IBM_PC_CPU (61 pins), IBM_PC_RAM (36 pins), IBM_PC_ROM_BIOS (16 pins), pc_data_bus_leds (22 pins), pc_data_bus_input_switches (16 pins), pc_address_bus_leds (44 pins), seven_segment_displays (18 pins), buzzer (C76.1 C77.2 Q1.3 R117.2), USB_TTL_converter (P34.4), micro_sd (5 pins), NOR_flash (6 pins), stm32h750 (8 pins), LCD_RGB_parallel_connector (P37.5 P37.6), stm32f411 (6 pins)
Vdd_3.3V: power_supply (C6.1 C7.1 M2.4 R2.2), FPGA_J6_J8 (15 pins), FPGA_breadboard_connections (P16.14 P17.14 P20.10 P21.14), IBM_PC_CPU (20 pins), IBM_PC_RAM (24 pins), IBM_PC_ROM_BIOS (P27.3 P27.5 P29.3 P29.5), pc_data_bus_leds (U6.20 U7.20), pc_data_bus_input_switches (32 pins), pc_address_bus_leds (U8.20 U9.20 U10.20 U11.20), seven_segment_displays (6 pins), micro_sd (C90.2 C91.2 S33.4 SJ1.1), NOR_flash (10 pins), LCD_RGB_parallel_connector (P37.1 P37.2)
Vdd_5V: power_supply (C1.1 C2.1 M1.4 R1.2), FPGA_breadboard_connections (P16.13 P17.13 P20.9 P21.13), IBM_PC_CPU (31 pins), buzzer (C76.2 C77.1 LS1.1), stm32h750 (6 pins), stm32f411 (6 pins)
Vdd_5V_LCD: power_supply (C8.1 C9.1 M3.4 R3.2), LCD_RGB_parallel_connector (P37.3 P37.4)
A0_latch_3v: FPGA_J6_J8 (M4.J6_10), FPGA_breadboard_connections (P19.20), pc_address_bus_leds (U8.8), stm32h750 (M5.J3_44)
A1_latch_3v: FPGA_J6_J8 (M4.J6_7), FPGA_breadboard_connections (P19.3), IBM_PC_RAM (IC2.3 IC3.3 P22.25), IBM_PC_ROM_BIOS (P27.29 P29.29), pc_address_bus_leds (U8.6), stm32h750 (M5.J3_43)
A2_latch_3v: FPGA_J6_J8 (M4.J6_14), FPGA_breadboard_connections (P21.1), IBM_PC_RAM (IC2.4 IC3.4 P22.24), IBM_PC_ROM_BIOS (P27.27 P29.27), pc_address_bus_leds (U8.4), stm32h750 (M5.J3_42)
A3_latch_3v: FPGA_J6_J8 (M4.J6_9), FPGA_breadboard_connections (P19.4), IBM_PC_RAM (IC2.5 IC3.5 P22.23), IBM_PC_ROM_BIOS (P27.25 P29.25), pc_address_bus_leds (U8.2), stm32h750 (M5.J3_41)
A4_latch_3v: FPGA_J6_J8 (M4.J6_16), FPGA_breadboard_connections (P21.2), IBM_PC_RAM (IC2.6 IC3.6 P22.22), IBM_PC_ROM_BIOS (P27.23 P29.23), pc_address_bus_leds (U11.17), stm32h750 (M5.J3_40)
A5_latch_3v: FPGA_J6_J8 (M4.J6_13), FPGA_breadboard_connections (P19.5), IBM_PC_RAM (IC2.7 IC3.7 P22.21), IBM_PC_ROM_BIOS (P27.21 P29.21), pc_address_bus_leds (U11.15), stm32h750 (M5.J3_39)
A6_latch_3v: FPGA_J6_J8 (M4.J6_18), FPGA_breadboard_connections (P21.3), IBM_PC_RAM (IC2.16 IC3.16 P22.20), IBM_PC_ROM_BIOS (P27.19 P29.19), pc_address_bus_leds (U11.13), stm32h750 (M5.J3_38)
A7_latch_3v: FPGA_J6_J8 (M4.J6_15), FPGA_breadboard_connections (P19.6), IBM_PC_RAM (IC2.17 IC3.17 P22.19), IBM_PC_ROM_BIOS (P27.17 P29.17), pc_address_bus_leds (U11.11), stm32h750 (M5.J3_37)
A8_latch_3v: FPGA_J6_J8 (M4.J6_20), FPGA_breadboard_connections (P21.4), IBM_PC_RAM (IC2.18 IC3.18 P22.18), IBM_PC_ROM_BIOS (P27.15 P29.15), pc_address_bus_leds (U11.8), stm32h750 (M5.J3_36)
A9_latch_3v: FPGA_J6_J8 (M4.J6_19), FPGA_breadboard_connections (P19.8), IBM_PC_RAM (IC2.19 IC3.19 P22.17), IBM_PC_ROM_BIOS (P26.6 P28.6), pc_address_bus_leds (U11.6), stm32h750 (M5.J3_35)
A10_latch_3v: FPGA_J6_J8 (M4.J6_24), FPGA_breadboard_connections (P21.5), IBM_PC_RAM (IC2.20 IC3.20 P22.16), IBM_PC_ROM_BIOS (P26.8 P28.8), pc_address_bus_leds (U11.4), stm32h750 (M5.J3_34)
A11_latch_3v: FPGA_J6_J8 (M4.J6_23), FPGA_breadboard_connections (P19.9), IBM_PC_RAM (IC2.26 IC3.26 P22.15), IBM_PC_ROM_BIOS (P26.14 P28.14), pc_address_bus_leds (U11.2), stm32h750 (M5.J3_33)
A12_latch_3v: FPGA_J6_J8 (M4.J6_26), FPGA_breadboard_connections (P21.6), IBM_PC_RAM (IC2.27 IC3.27 P22.14), IBM_PC_ROM_BIOS (P26.10 P28.10), pc_address_bus_leds (U9.17), stm32h750 (M5.J3_32)
A13_latch_3v: FPGA_J6_J8 (M4.J6_25), FPGA_breadboard_connections (P19.10), IBM_PC_RAM (IC2.28 IC3.28 P22.13), IBM_PC_ROM_BIOS (P27.13 P29.13), pc_address_bus_leds (U9.15), stm32h750 (M5.J3_31)
A14_latch_3v: FPGA_J6_J8 (M4.J6_28), FPGA_breadboard_connections (P21.7), IBM_PC_RAM (IC2.29 IC3.29 P22.12), IBM_PC_ROM_BIOS (P26.4 P28.4), pc_address_bus_leds (U9.13), stm32h750 (M5.J3_29)
A15_latch_3v: FPGA_J6_J8 (M4.J6_27), FPGA_breadboard_connections (P19.11), IBM_PC_RAM (IC2.30 IC3.30 P22.11), IBM_PC_ROM_BIOS (P26.2 P28.2), pc_address_bus_leds (U9.11), stm32h750 (M5.J3_28)
A16_3v: FPGA_J6_J8 (M4.J8_6), FPGA_breadboard_connections (P15.18), IBM_PC_CPU (U1.21)
A16_latch_3v: FPGA_J6_J8 (M4.J6_30), FPGA_breadboard_connections (P21.8), IBM_PC_RAM (IC2.38 IC3.38 P22.10), IBM_PC_ROM_BIOS (P27.11 P29.11), pc_address_bus_leds (U9.8), stm32h750 (M5.J3_27)
A17_3v: FPGA_J6_J8 (M4.J8_8), FPGA_breadboard_connections (P15.19), IBM_PC_CPU (U1.20)
A17_latch_3v: FPGA_J6_J8 (M4.J6_29), FPGA_breadboard_connections (P19.12), IBM_PC_RAM (IC2.39 IC3.39 P22.9), IBM_PC_ROM_BIOS (P27.9 P29.9), pc_address_bus_leds (U9.6), stm32h750 (M5.J3_26)
A18_3v: FPGA_J6_J8 (M4.J8_10), FPGA_breadboard_connections (P15.20), IBM_PC_CPU (U1.19)
A18_latch_3v: FPGA_J6_J8 (M4.J6_36), FPGA_breadboard_connections (P21.10), IBM_PC_RAM (IC2.40 IC3.40 P22.8), IBM_PC_ROM_BIOS (P27.1 P29.1), pc_address_bus_leds (U9.4), stm32h750 (M5.J3_25)
A19_3v: FPGA_J6_J8 (M4.J8_16), FPGA_breadboard_connections (P17.2), IBM_PC_CPU (U1.18)
A19_latch_3v: FPGA_J6_J8 (M4.J6_33), FPGA_breadboard_connections (P19.13), IBM_PC_RAM (IC2.41 IC3.41 P22.7), IBM_PC_ROM_BIOS (P27.7 P29.7), pc_address_bus_leds (U9.2), stm32h750 (M5.J3_23)
AD0_3v: FPGA_J6_J8 (M4.J8_30), FPGA_breadboard_connections (P17.8), IBM_PC_CPU (U2.21), IBM_PC_RAM (IC3.9 P24.16), IBM_PC_ROM_BIOS (P29.31), pc_data_bus_leds (U7.17), pc_data_bus_input_switches (P30.31), stm32h750 (M5.J3_22)
AD1_3v: FPGA_J6_J8 (M4.J8_18), FPGA_breadboard_connections (P17.3 P17.9), IBM_PC_CPU (U2.20), IBM_PC_RAM (IC3.10 P24.15), IBM_PC_ROM_BIOS (P28.32), pc_data_bus_leds (U7.15), pc_data_bus_input_switches (P30.29), stm32h750 (M5.J3_21)
AD2_3v: FPGA_J6_J8 (M4.J8_29), FPGA_breadboard_connections (P15.12), IBM_PC_CPU (U2.19), IBM_PC_RAM (IC3.13 P24.14), IBM_PC_ROM_BIOS (P28.30), pc_data_bus_leds (U7.13), pc_data_bus_input_switches (P30.27), stm32h750 (M5.J3_20)
AD3_3v: FPGA_J6_J8 (M4.J8_25), FPGA_breadboard_connections (P15.10), IBM_PC_CPU (U2.18), IBM_PC_RAM (IC3.14 P24.13), IBM_PC_ROM_BIOS (P28.26), pc_data_bus_leds (U7.11), pc_data_bus_input_switches (P30.25), stm32h750 (M5.J3_19)
AD4_3v: FPGA_J6_J8 (M4.J8_23), FPGA_breadboard_connections (P15.9), IBM_PC_CPU (U2.17), IBM_PC_RAM (IC3.31 P24.12), IBM_PC_ROM_BIOS (P28.24), pc_data_bus_leds (U7.8), pc_data_bus_input_switches (P30.23), stm32h750 (M5.J3_18)
AD5_3v: FPGA_J6_J8 (M4.J8_24), FPGA_breadboard_connections (P17.5), IBM_PC_CPU (U2.16), IBM_PC_RAM (IC3.32 P24.11), IBM_PC_ROM_BIOS (P28.22), pc_data_bus_leds (U7.6), pc_data_bus_input_switches (P30.21), stm32h750 (M5.J3_17)
AD6_3v: FPGA_J6_J8 (M4.J8_19), FPGA_breadboard_connections (P15.8), IBM_PC_CPU (U2.15), IBM_PC_RAM (IC3.35 P24.10), IBM_PC_ROM_BIOS (P28.20), pc_data_bus_leds (U7.4), pc_data_bus_input_switches (P30.19), stm32h750 (M5.J3_16)
AD7_3v: FPGA_J6_J8 (M4.J8_17), FPGA_breadboard_connections (P15.7), IBM_PC_CPU (U2.14), IBM_PC_RAM (IC3.36 P24.9), IBM_PC_ROM_BIOS (P28.18), pc_data_bus_leds (U7.2), pc_data_bus_input_switches (P30.17), stm32h750 (M5.J3_13)
AD8_3v: FPGA_J6_J8 (M4.J8_15), FPGA_breadboard_connections (P15.6), IBM_PC_CPU (U4.21), IBM_PC_RAM (IC2.9 P24.8), IBM_PC_ROM_BIOS (P27.31), pc_data_bus_leds (U6.17), pc_data_bus_input_switches (P30.15), stm32h750 (M5.J3_12)
AD9_3v: FPGA_J6_J8 (M4.J8_13), FPGA_breadboard_connections (P15.5), IBM_PC_CPU (U4.20), IBM_PC_RAM (IC2.10 P24.7), IBM_PC_ROM_BIOS (P26.32), pc_data_bus_leds (U6.15), pc_data_bus_input_switches (P30.13), stm32h750 (M5.J3_11)
AD10_3v: FPGA_J6_J8 (M4.J8_9), FPGA_breadboard_connections (P15.4), IBM_PC_CPU (U4.19), IBM_PC_RAM (IC2.13 P24.6), IBM_PC_ROM_BIOS (P26.30), pc_data_bus_leds (U6.13), pc_data_bus_input_switches (P30.11), stm32h750 (M5.J2_10)
AD11_3v: FPGA_J6_J8 (M4.J8_5), FPGA_breadboard_connections (P15.2), IBM_PC_CPU (U4.18), IBM_PC_RAM (IC2.14 P24.5), IBM_PC_ROM_BIOS (P26.26), pc_data_bus_leds (U6.11), pc_data_bus_input_switches (P30.9), stm32h750 (M5.J2_9)
AD12_3v: FPGA_J6_J8 (M4.J8_3), FPGA_breadboard_connections (P15.1), IBM_PC_CPU (U4.17), IBM_PC_RAM (IC2.31 P24.4), IBM_PC_ROM_BIOS (P26.24), pc_data_bus_leds (U6.8), pc_data_bus_input_switches (P30.7), stm32h750 (M5.J2_12)
AD13_3v: FPGA_J6_J8 (M4.J6_4), FPGA_breadboard_connections (P19.17), IBM_PC_CPU (U4.16), IBM_PC_RAM (IC2.32 P24.3), IBM_PC_ROM_BIOS (P26.22), pc_data_bus_leds (U6.6), pc_data_bus_input_switches (P30.5), stm32h750 (M5.J2_11)
AD14_3v: FPGA_J6_J8 (M4.J6_3), FPGA_breadboard_connections (P19.1), IBM_PC_CPU (U4.15), IBM_PC_RAM (IC2.35 P24.2), IBM_PC_ROM_BIOS (P26.20), pc_data_bus_leds (U6.4), pc_data_bus_input_switches (P30.3), stm32h750 (M5.J2_14)
AD15_3v: FPGA_J6_J8 (M4.J8_4), FPGA_breadboard_connections (P15.17), IBM_PC_CPU (U4.14), IBM_PC_RAM (IC2.36 P24.1), IBM_PC_ROM_BIOS (P26.18), pc_data_bus_leds (U6.2), pc_data_bus_input_switches (P30.1), stm32h750 (M5.J2_15)
ALE_3v_PCLKT5_0: FPGA_J6_J8 (M4.J8_28), FPGA_breadboard_connections (P17.7), IBM_PC_CPU (U3.21), pc_address_bus_leds (U10.11), stm32h750 (M5.J2_13)
~{BHE}_3v: FPGA_J6_J8 (P8.2), IBM_PC_CPU (U1.17), pc_address_bus_leds (U10.6)
~{BHE}_latch_3v: FPGA_J6_J8 (M4.J6_8), FPGA_breadboard_connections (P19.19)
BIOS_~{CE}_high_byte: IBM_PC_RAM (P22.3), IBM_PC_ROM_BIOS (P26.16), pc_address_bus_leds (U8.15)
BIOS_~{CE}_low_byte: IBM_PC_RAM (P22.4), IBM_PC_ROM_BIOS (P28.16), pc_address_bus_leds (U8.17)
CPU_CLK_3v: FPGA_J6_J8 (P9.4), IBM_PC_CPU (U5.19)
CPU_RESET_3v: FPGA_J6_J8 (P8.8), IBM_PC_CPU (U5.20)
FPGA1_MCU_STM32H750: FPGA_J3_J4 (P1.23), stm32h750 (M5.J2_30)
FPGA2_MCU_STM32H750: FPGA_J3_J4 (P1.25), stm32h750 (M5.J2_32)
FPGA3_MCU_STM32H750: FPGA_J3_J4 (P1.27), stm32h750 (M5.J2_34)
FPGA4_MCU_STM32H750: FPGA_J3_J4 (P1.29), stm32h750 (M5.J2_33)
FPGA5_MCU_STM32H750: FPGA_J3_J4 (P1.31), stm32h750 (M5.J2_35)
FPGA6_MCU_STM32H750: FPGA_J3_J4 (P1.33), stm32h750 (M5.J2_38)
FPGA7_MCU_STM32H750: FPGA_J3_J4 (P1.35), stm32h750 (M5.J2_37)
FPGA8_MCU_STM32H750: FPGA_J3_J4 (P1.37), stm32h750 (M5.J2_40)
FPGA9_MCU_STM32H750: FPGA_J3_J4 (P1.39), stm32h750 (M5.J2_39)
FPGA10_MCU_STM32H750: FPGA_J3_J4 (P1.41), stm32h750 (M5.J2_44)
FPGA11_MCU_STM32H750: FPGA_J3_J4 (P1.43), stm32h750 (M5.J2_43)
FPGA-LCD_BACKLIGHT_PWM: FPGA_J3_J4 (P1.21), LCD_RGB_parallel_connector (P38.22)
FPGA-LCD_BLUE_BIT6: FPGA_J3_J4 (P1.1), LCD_RGB_parallel_connector (P38.2)
FPGA-LCD_BLUE_BIT7: FPGA_J3_J4 (P1.3), LCD_RGB_parallel_connector (P38.4)
FPGA-LCD_DE-FPC_PIN9: FPGA_J3_J4 (P1.7), LCD_RGB_parallel_connector (P38.8)
FPGA-LCD_HSYNC-FPC_PIN11: FPGA_J3_J4 (P1.11), LCD_RGB_parallel_connector (P38.12)
FPGA-LCD_MODE-FPC_PIN8: FPGA_J3_J4 (P1.5), LCD_RGB_parallel_connector (P38.6)
FPGA-LCD_PCLK-FPC_PIN37: FPGA_J3_J4 (P1.13), LCD_RGB_parallel_connector (P38.14)
FPGA-LCD_RESET-FPC_PIN44: FPGA_J3_J4 (P1.19), LCD_RGB_parallel_connector (P38.20)
FPGA-LCD_SHLR-FPC_PIN39: FPGA_J3_J4 (P1.15), LCD_RGB_parallel_connector (P38.16)
FPGA-LCD_UPDN-FPC_PIN40: FPGA_J3_J4 (P1.17), LCD_RGB_parallel_connector (P38.18)
FPGA-LCD_VSYNC-FPC_PIN10: FPGA_J3_J4 (P1.9), LCD_RGB_parallel_connector (P38.10)
~{INTA}_3v: FPGA_J6_J8 (P9.2), IBM_PC_CPU (U3.20)
INTR_3v: FPGA_J6_J8 (P9.6), IBM_PC_CPU (U5.18), pc_address_bus_leds (U10.15)
IO_A3: FPGA_J3_J4 (M4.J3_40), FPGA_breadboard_connections (P20.8), micro_sd (P40.5)
IO_A4: FPGA_J3_J4 (M4.J3_38), FPGA_breadboard_connections (P20.7), buzzer (P33.1)
IO_A5: FPGA_J3_J4 (M4.J3_36), FPGA_breadboard_connections (P20.6), micro_sd (P40.4)
IO_A10: FPGA_J3_J4 (M4.J3_27 P1.20 P1.26), FPGA_breadboard_connections (P18.10), seven_segment_displays (U14.4)
IO_B1: FPGA_J6_J8 (M4.J8_35 P9.5 P9.13), FPGA_breadboard_connections (P15.14)
IO_B4: FPGA_J3_J4 (M4.J3_37), FPGA_breadboard_connections (P18.14), seven_segment_displays (U14.13)
IO_B5: FPGA_J3_J4 (M4.J3_35), FPGA_breadboard_connections (P18.13), seven_segment_displays (U14.11)
IO_B6: FPGA_J3_J4 (M4.J3_33), FPGA_breadboard_connections (P18.12), seven_segment_displays (U14.8)
IO_B7: FPGA_J3_J4 (M4.J3_34), FPGA_breadboard_connections (P20.5), seven_segment_displays (U15.2)
IO_B9: FPGA_J3_J4 (M4.J3_30 P1.16 P1.30), FPGA_breadboard_connections (P20.4), seven_segment_displays (U13.17)
IO_B12: FPGA_J3_J4 (M4.J3_6), FPGA_breadboard_connections (P18.15), seven_segment_displays (U14.15)
IO_B16: FPGA_J3_J4 (M4.J4_40), FPGA_breadboard_connections (P16.12), micro_sd (P40.2)
IO_C1: FPGA_J6_J8 (M4.J8_33 P9.7 P9.15), FPGA_breadboard_connections (P15.13)
IO_C4: FPGA_J3_J4 (M4.J3_26 P1.14 P1.32), FPGA_breadboard_connections (P20.2), seven_segment_displays (U13.13)
IO_C5: FPGA_J3_J4 (M4.J3_23 P1.12 P1.34), FPGA_breadboard_connections (P18.8), seven_segment_displays (U12.17)
IO_C7: FPGA_J3_J4 (M4.J3_20 P1.10 P1.36), FPGA_breadboard_connections (P18.20), seven_segment_displays (U13.8)
IO_C12: FPGA_J3_J4 (M4.J3_7), FPGA_breadboard_connections (P18.2), seven_segment_displays (U12.4), stm32h750 (M5.J2_25)
IO_C15: FPGA_J3_J4 (M4.J4_36), FPGA_breadboard_connections (P16.10), stm32f411 (P39.2)
IO_D3: FPGA_J6_J8 (M4.J8_36 P8.5 P8.13), FPGA_breadboard_connections (P17.11)
IO_D6: FPGA_J3_J4 (M4.J3_24), FPGA_breadboard_connections (P20.1), seven_segment_displays (U13.11)
IO_D7: FPGA_J3_J4 (M4.J3_19 P1.8 P1.38), FPGA_breadboard_connections (P18.7), seven_segment_displays (U12.15)
IO_D8: FPGA_J3_J4 (M4.J3_18 P1.6 P1.40), FPGA_breadboard_connections (P18.19), seven_segment_displays (U13.6)
IO_D9: FPGA_J3_J4 (M4.J3_29), FPGA_breadboard_connections (P18.11), seven_segment_displays (U14.6)
IO_D10: FPGA_J3_J4 (M4.J3_10), FPGA_breadboard_connections (P18.17), seven_segment_displays (U13.2), stm32h750 (M5.J2_28)
IO_D14: FPGA_J3_J4 (M4.J4_37), FPGA_breadboard_connections (P14.15), seven_segment_displays (U17.13), stm32f411 (M6.17)
IO_E3: FPGA_J6_J8 (M4.J8_37 P9.3 P9.11), FPGA_breadboard_connections (P15.15)
IO_E6: FPGA_J3_J4 (M4.J3_25 P1.22 P1.24), FPGA_breadboard_connections (P18.9), seven_segment_displays (U14.2)
IO_E7: FPGA_J3_J4 (M4.J3_17 P1.4 P1.42), FPGA_breadboard_connections (P18.6), seven_segment_displays (U12.13)
IO_E8: FPGA_J3_J4 (M4.J3_15), FPGA_breadboard_connections (P18.5), seven_segment_displays (U12.11), stm32h750 (M5.J2_31)
IO_E9: FPGA_J3_J4 (M4.J3_16 P1.2 P1.44), FPGA_breadboard_connections (P18.18), seven_segment_displays (U13.4)
IO_E10: FPGA_J3_J4 (M4.J3_9), FPGA_breadboard_connections (P18.3), seven_segment_displays (U12.6), stm32h750 (M5.J2_27)
IO_E11: FPGA_J3_J4 (M4.J3_8), FPGA_breadboard_connections (P18.16), seven_segment_displays (U14.17), stm32h750 (M5.J2_26)
IO_E14: FPGA_J3_J4 (M4.J4_34), FPGA_breadboard_connections (P16.9), stm32f411 (M6.23)
IO_E15: FPGA_J3_J4 (M4.J4_30), FPGA_breadboard_connections (P16.8), stm32f411 (M6.24)
IO_E16: FPGA_J3_J4 (M4.J4_33), FPGA_breadboard_connections (P14.13), seven_segment_displays (U17.11), stm32f411 (M6.16)
IO_F3: FPGA_J6_J8 (M4.J8_38 P8.7 P8.15), FPGA_breadboard_connections (P17.12)
IO_F5: FPGA_J6_J8 (M4.J8_39 P9.1 P9.9), FPGA_breadboard_connections (P15.16)
IO_F7: FPGA_J3_J4 (M4.J3_28 P1.18 P1.28), FPGA_breadboard_connections (P20.3), seven_segment_displays (U13.15)
IO_F8: FPGA_J3_J4 (M4.J3_5), FPGA_breadboard_connections (P18.1), seven_segment_displays (U12.2), stm32h750 (M5.J2_23)
IO_F9: FPGA_J3_J4 (M4.J3_13), FPGA_breadboard_connections (P18.4), seven_segment_displays (U12.8), stm32h750 (M5.J2_29)
IO_F14: FPGA_J3_J4 (M4.J4_38), FPGA_breadboard_connections (P16.11), micro_sd (P40.1)
IO_F15: FPGA_J3_J4 (M4.J4_28), FPGA_breadboard_connections (P16.7), stm32f411 (M6.26)
IO_F16: FPGA_J3_J4 (M4.J4_29), FPGA_breadboard_connections (P14.12), seven_segment_displays (U17.8), stm32f411 (M6.15)
IO_G3: FPGA_J6_J8 (M4.J8_34 P8.3 P8.11), FPGA_breadboard_connections (P17.10)
IO_G14: FPGA_J3_J4 (M4.J4_39), FPGA_breadboard_connections (P14.16), micro_sd (P40.3)
IO_G15: FPGA_J3_J4 (M4.J4_26), FPGA_breadboard_connections (P16.6), seven_segment_displays (U16.17), stm32f411 (M6.27)
IO_G16: FPGA_J3_J4 (M4.J4_27), FPGA_breadboard_connections (P14.11), seven_segment_displays (U17.6), stm32f411 (M6.14)
IO_H15: FPGA_J3_J4 (M4.J4_24), FPGA_breadboard_connections (P16.5), seven_segment_displays (U16.15), stm32f411 (M6.28)
IO_H16: FPGA_J3_J4 (M4.J4_25), FPGA_breadboard_connections (P14.10), seven_segment_displays (U17.4), stm32f411 (M6.13)
IO_J14: FPGA_J3_J4 (M4.J4_18), FPGA_breadboard_connections (P16.3), seven_segment_displays (U16.11), stm32f411 (M6.30)
IO_J15: FPGA_J3_J4 (M4.J4_20), FPGA_breadboard_connections (P16.4), seven_segment_displays (U16.13), stm32f411 (M6.29)
IO_J16: FPGA_J3_J4 (M4.J4_23), FPGA_breadboard_connections (P14.9), seven_segment_displays (U17.2), stm32f411 (M6.12)
IO_K12: FPGA_J3_J4 (M4.J4_3), FPGA_breadboard_connections (P14.1), seven_segment_displays (U15.4), stm32f411 (M6.5)
IO_K13: FPGA_J3_J4 (M4.J4_4), FPGA_breadboard_connections (P14.17), seven_segment_displays (U17.15), stm32f411 (M6.37)
IO_K14: FPGA_J3_J4 (M4.J4_15), FPGA_breadboard_connections (P14.6), seven_segment_displays (U15.15), stm32f411 (M6.10)
IO_K15: FPGA_J3_J4 (M4.J4_17), FPGA_breadboard_connections (P14.7), seven_segment_displays (U15.17), stm32f411 (M6.11)
IO_K16: FPGA_J3_J4 (M4.J4_16), FPGA_breadboard_connections (P16.2), seven_segment_displays (U16.8), stm32f411 (M6.31)
IO_L14: FPGA_J3_J4 (M4.J4_7), FPGA_breadboard_connections (P14.3), seven_segment_displays (U15.8), stm32f411 (M6.7)
IO_L15: FPGA_J3_J4 (M4.J4_13), FPGA_breadboard_connections (P14.5), seven_segment_displays (U15.13)
IO_L16: FPGA_J3_J4 (M4.J4_14), FPGA_breadboard_connections (P16.1), seven_segment_displays (U16.6), stm32f411 (M6.32)
IO_M14: FPGA_J3_J4 (M4.J4_5), FPGA_breadboard_connections (P14.2), seven_segment_displays (U15.6), stm32f411 (M6.6)
IO_M15: FPGA_J3_J4 (M4.J4_9), FPGA_breadboard_connections (P14.4), seven_segment_displays (U15.11)
IO_M16: FPGA_J3_J4 (M4.J4_10), FPGA_breadboard_connections (P14.20), seven_segment_displays (U16.4), stm32f411 (M6.33)
IO_N14: FPGA_J3_J4 (M4.J4_6), FPGA_breadboard_connections (P14.18), seven_segment_displays (U17.17), stm32f411 (M6.35)
IO_N16: FPGA_J3_J4 (M4.J4_8), FPGA_breadboard_connections (P14.19), seven_segment_displays (U16.2), stm32f411 (M6.34)
IO_R4: FPGA_J6_J8 (M4.J6_37), FPGA_breadboard_connections (P19.15), USB_TTL_converter (P34.1)
IO_T3: FPGA_J6_J8 (M4.J6_39), FPGA_breadboard_connections (P19.16), USB_TTL_converter (P34.2)
IO_T4: FPGA_J6_J8 (M4.J6_40), FPGA_breadboard_connections (P21.12), USB_TTL_converter (P34.3)
L_GPLLT_IN: FPGA_J6_J8 (7 pins), FPGA_breadboard_connections (P15.11)
LEVEL_SHIFT_DIR: FPGA_J6_J8 (M4.J6_6), FPGA_breadboard_connections (P19.18), IBM_PC_CPU (U2.2 U4.2)
LEVEL_SHIFT_~{OE}: FPGA_J6_J8 (M4.J6_5), FPGA_breadboard_connections (P19.2), IBM_PC_CPU (U2.22 U4.22)
M/~{IO}_3v: FPGA_J6_J8 (P8.4), IBM_PC_CPU (U1.14), pc_address_bus_leds (U10.8)
MCU-LCD_BACKLIGHT_PWM: stm32h750 (M5.J2_20), LCD_RGB_parallel_connector (P38.44)
MCU-LCD_BLUE_BIT6: stm32h750 (M5.J2_42), LCD_RGB_parallel_connector (P38.24)
MCU-LCD_BLUE_BIT7: stm32h750 (M5.J2_41), LCD_RGB_parallel_connector (P38.26)
MCU-LCD_DE-FPC_PIN9: stm32h750 (M5.J3_15), LCD_RGB_parallel_connector (P38.30)
MCU-LCD_HSYNC-FPC_PIN11: stm32h750 (M5.J2_16), LCD_RGB_parallel_connector (P38.34)
MCU-LCD_MODE-FPC_PIN8: stm32h750 (M5.J2_8), LCD_RGB_parallel_connector (P38.28)
MCU-LCD_PCLK-FPC_PIN37: stm32h750 (M5.J3_14), LCD_RGB_parallel_connector (P38.36)
MCU-LCD_RESET-FPC_PIN44: stm32h750 (M5.J2_7), LCD_RGB_parallel_connector (P38.42)
MCU-LCD_SHLR-FPC_PIN39: stm32h750 (M5.J2_22), LCD_RGB_parallel_connector (P38.38)
MCU-LCD_UPDN-FPC_PIN40: stm32h750 (M5.J2_19), LCD_RGB_parallel_connector (P38.40)
MCU-LCD_VSYNC-FPC_PIN10: stm32h750 (M5.J3_30), LCD_RGB_parallel_connector (P38.32)
micro_sd_CARD_DETECT: micro_sd (P42.5), stm32f411 (M6.22)
micro_sd_CS: micro_sd (P42.1), stm32f411 (M6.1)
micro_sd_MISO: micro_sd (P42.4), stm32f411 (M6.3)
micro_sd_MOSI: micro_sd (P42.2), stm32f411 (M6.4)
micro_sd_SCK: micro_sd (P42.3), stm32f411 (M6.2)
NMI_3v: FPGA_J6_J8 (P9.8), IBM_PC_CPU (U5.17), pc_address_bus_leds (U10.17)
NOR_FLASH_1_CS: FPGA_J6_J8 (P8.10), NOR_flash (IC10.1 P35.2 R119.2)
NOR_FLASH_1_MISO: FPGA_J6_J8 (P8.12), NOR_flash (IC10.2 P35.4)
NOR_FLASH_1_MOSI: FPGA_J6_J8 (P8.14), NOR_flash (IC10.5 P35.8)
NOR_FLASH_1_SCK: FPGA_J6_J8 (P8.16), NOR_flash (IC10.6 P35.10)
NOR_FLASH_2_CS: FPGA_J6_J8 (P9.10), NOR_flash (IC11.1 P36.2 R121.2)
NOR_FLASH_2_MISO: FPGA_J6_J8 (P9.12), NOR_flash (IC11.2 P36.4)
NOR_FLASH_2_MOSI: FPGA_J6_J8 (P9.14), NOR_flash (IC11.5 P36.8)
NOR_FLASH_2_SCK: FPGA_J6_J8 (P9.16), NOR_flash (IC11.6 P36.10)
PCLKT1_0: FPGA_J3_J4 (M4.J4_19), FPGA_J6_J8 (6 pins), FPGA_breadboard_connections (P14.8)
PCLKT2_0: FPGA_J6_J8 (7 pins), FPGA_breadboard_connections (P21.9)
PCLKT2_1: FPGA_J6_J8 (7 pins), FPGA_breadboard_connections (P19.7)
PCLKT3_0: FPGA_J6_J8 (7 pins), FPGA_breadboard_connections (P15.3)
PCLKT4_0: FPGA_J6_J8 (7 pins), FPGA_breadboard_connections (P17.1)
~{RD}_3v: FPGA_J6_J8 (M4.J8_20), FPGA_breadboard_connections (P17.4), IBM_PC_CPU (U1.16), IBM_PC_RAM (IC2.37 IC3.37 P22.5), IBM_PC_ROM_BIOS (P26.12 P28.12), pc_address_bus_leds (U10.2), stm32h750 (M5.J2_18)
R_GPLLT_IN: FPGA_J3_J4 (M4.J4_35), FPGA_J6_J8 (6 pins), FPGA_breadboard_connections (P14.14)
RAM_~{CE}_high_byte: FPGA_J6_J8 (M4.J6_35), FPGA_breadboard_connections (P19.14), IBM_PC_RAM (IC2.8 P22.1), pc_address_bus_leds (U8.11)
RAM_~{CE}_low_byte: FPGA_J6_J8 (M4.J6_38), FPGA_breadboard_connections (P21.11), IBM_PC_RAM (IC3.8 P22.2), pc_address_bus_leds (U8.13)
READY_3v: FPGA_J6_J8 (P8.6), IBM_PC_CPU (U5.21), pc_address_bus_leds (U10.13)
stm32f411_buzzer: buzzer (P33.5), stm32f411 (P39.4)
stm32h750_buzzer: buzzer (P33.3), stm32h750 (M5.J3_24)
stm32h750_NOR_FLASH_CS: NOR_flash (P35.1 P36.1), stm32h750 (M5.J3_10)
stm32h750_NOR_FLASH_WP: NOR_flash (P35.5 P36.5), stm32h750 (M5.J2_36)
stm32h750_SPI_MISO: NOR_flash (P35.3 P36.3), stm32h750 (M5.J3_8)
stm32h750_SPI_MOSI: NOR_flash (P35.7 P36.7), stm32h750 (M5.J3_7)
stm32h750_SPI_SCK: NOR_flash (P35.9 P36.9), stm32h750 (M5.J3_9)
~{WR}_3v: FPGA_J6_J8 (M4.J8_26), FPGA_breadboard_connections (P17.6), IBM_PC_CPU (U1.15), IBM_PC_RAM (IC2.15 IC3.15 P22.6), pc_address_bus_leds (U10.4), stm32h750 (M5.J2_17)